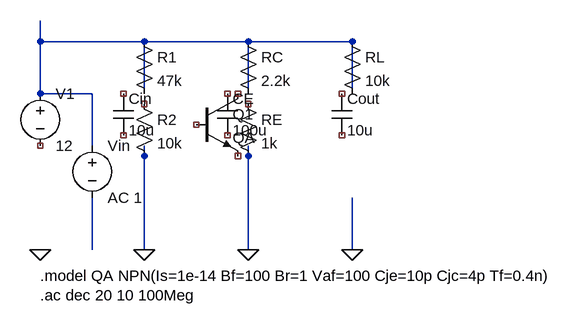
[diagram p0: schematic Ex12.asc]
Ex12.asc, the LTspice schematic file:
Version 4
SHEET 1 1920 1080
WIRE 80 80 80 48
WIRE 80 160 80 80
WIRE 240 80 80 80
WIRE 400 80 240 80
WIRE 560 80 400 80
WIRE 160 160 80 160
WIRE 240 160 240 80
WIRE 400 160 400 80
WIRE 560 160 560 80
WIRE 160 240 160 160
WIRE 240 320 240 240
WIRE 400 320 400 240
WIRE 160 400 160 320
WIRE 240 400 240 320
WIRE 400 400 400 320
WIRE 560 400 560 320
FLAG 80 400 0
FLAG 240 400 0
FLAG 400 400 0
FLAG 560 400 0
SYMBOL voltage 80 144 R0
WINDOW 123 0 0 Left 0
WINDOW 39 0 0 Left 0
SYMATTR InstName V1
SYMATTR Value 12
SYMBOL voltage 160 224 R0
WINDOW 123 24 44 Left 2
WINDOW 39 0 0 Left 0
SYMATTR InstName Vin
SYMATTR Value AC 1
SYMBOL cap 192 160 R0
SYMATTR InstName Cin
SYMATTR Value 10u
SYMBOL res 224 64 R0
SYMATTR InstName R1
SYMATTR Value 47k
SYMBOL res 224 160 R0
SYMATTR InstName R2
SYMATTR Value 10k
SYMBOL res 384 64 R0
SYMATTR InstName RC
SYMATTR Value 2.2k
SYMBOL res 384 160 R0
SYMATTR InstName RE
SYMATTR Value 1k
SYMBOL cap 352 160 R0
SYMATTR InstName CE
SYMATTR Value 100u
SYMBOL npn 320 160 R0
SYMATTR InstName Q1
SYMATTR Value QA
SYMBOL cap 528 160 R0
SYMATTR InstName Cout
SYMATTR Value 10u
SYMBOL res 544 64 R0
SYMATTR InstName RL
SYMATTR Value 10k
NET 80 80 vcc
NET 240 80 b
NET 400 80 c
NET 560 80 out
TEXT 80 440 Left 2 !.model QA NPN(Is=1e-14 Bf=100 Br=1 Vaf=100 Cje=10p Cjc=4p Tf=0.4n)
TEXT 80 470 Left 2 !.ac dec 20 10 100Meg

The netlist it stands for:
* Ex12.asc
V1 N001 NC_01 12
Vin N001 N002 AC 1
Cin NC_02 NC_03 10u
R1 N001 N001 47k
R2 NC_04 0 10k
RC N001 N001 2.2k
RE NC_05 0 1k
CE NC_06 NC_07 100u
Q1 NC_08 NC_09 NC_10 0 QA
Cout NC_11 NC_12 10u
RL N001 N001 10k
.model NPN NPN
.model PNP PNP
.lib standard.bjt
.model QA NPN(Is=1e-14 Bf=100 Br=1 Vaf=100 Cje=10p Cjc=4p Tf=0.4n)
.ac dec 20 10 100Meg
.backanno
.end